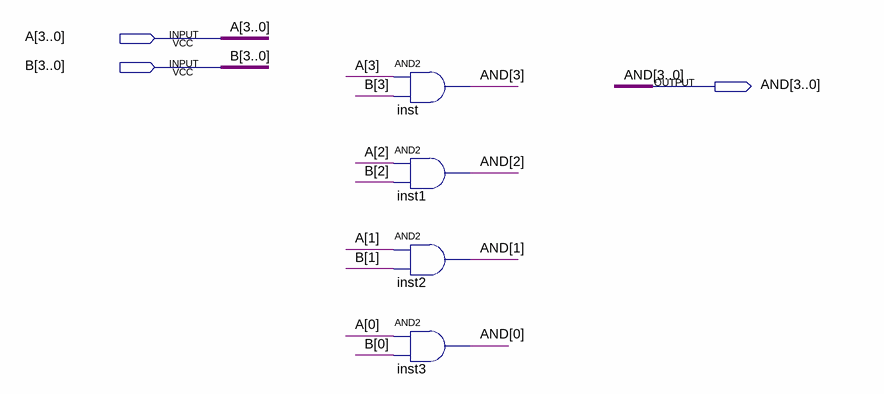
[diagram p0: schematic sheet]
// Quartus schematic AND_4bit.bdf as structural Verilog: 4 symbols, 3 pins
module AND_4bit (
  input  [3:0] A,
  input  [3:0] B,
  output [3:0] AND
);

  and inst (AND[3], A[3], B[3]);
  and inst1 (AND[2], A[2], B[2]);
  and inst2 (AND[1], A[1], B[1]);
  and inst3 (AND[0], A[0], B[0]);
endmodule
